# Altium schematic sheet semubot_lidar_driver.SchDoc
size A3; SheetNumber: 1; SheetTotal: 2
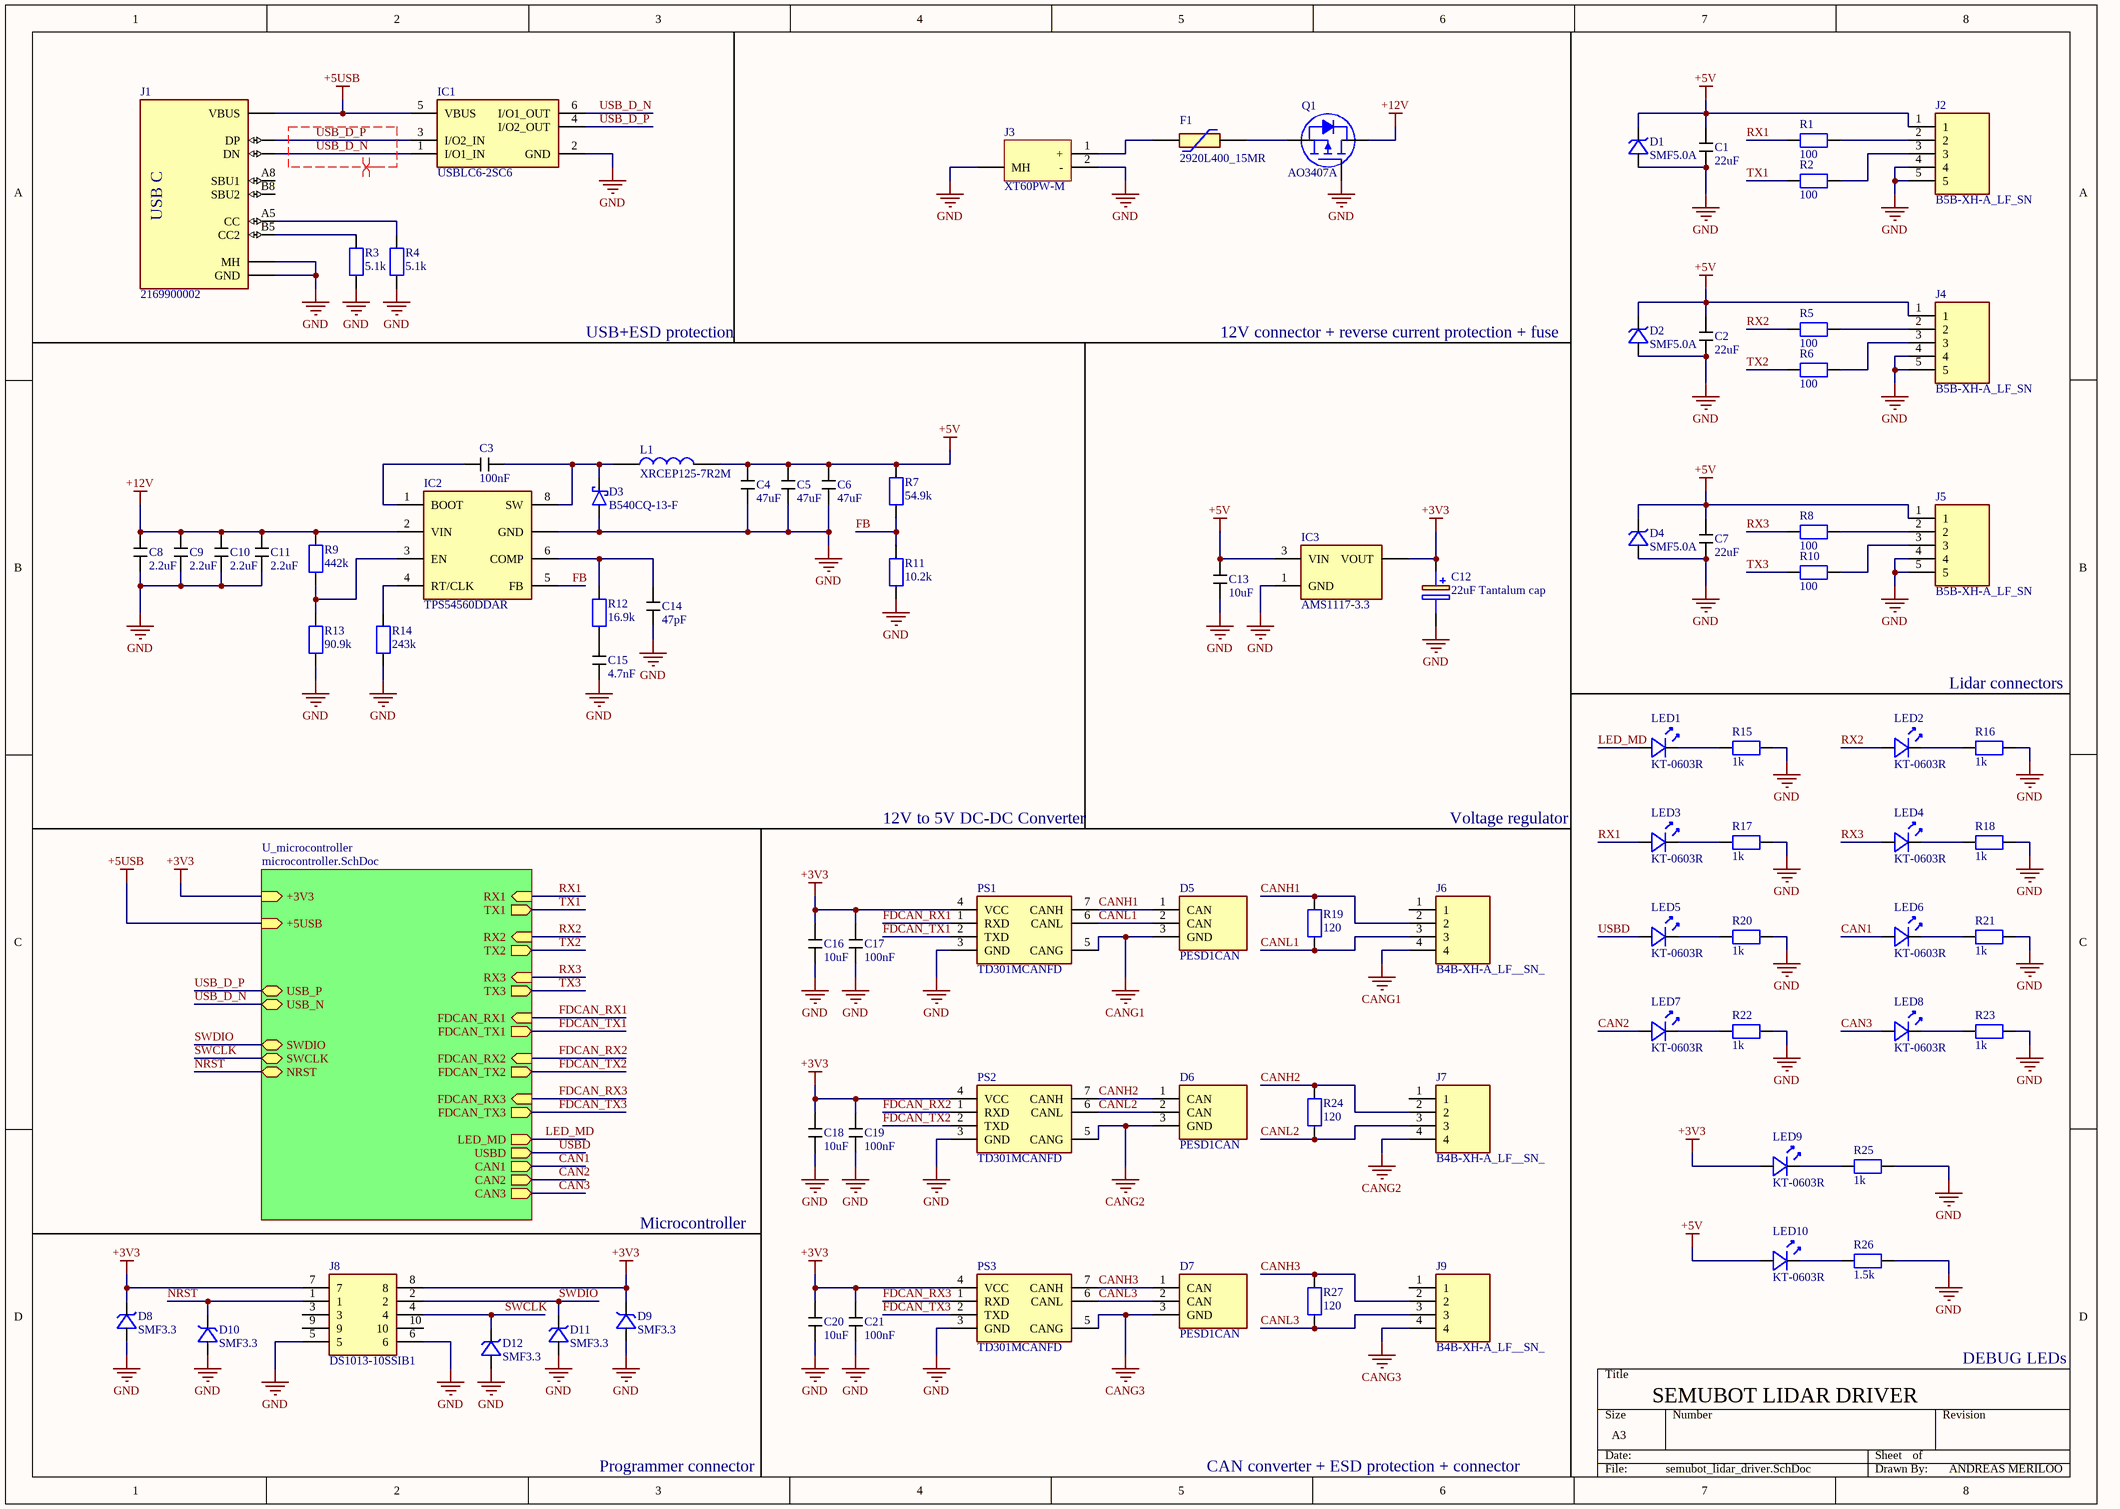
[diagram p0: semubot_lidar_driver.SchDoc]

## Parts
C1  22uF  [0805Capacitor]
C2  22uF  [0805Capacitor]
C3  100nF  [0603Capacitor]
C4  47uF  [1206CAPACITOR]
C5  47uF  [1206CAPACITOR]
C6  47uF  [1206CAPACITOR]
C7  22uF  [0805Capacitor]
C8  2.2uF  [1206CAPACITOR]
C9  2.2uF  [1206CAPACITOR]
C10  2.2uF  [1206CAPACITOR]
C11  2.2uF  [1206CAPACITOR]
C12  22uF Tantalum cap  [CAPPM3216X180N]
C13  10uF  [1206CAPACITOR]
C14  47pF  [0603Capacitor]
C15  4.7nF  [0805Capacitor]
C16  10uF  [1206CAPACITOR]
C17  100nF  [0603Capacitor]
C18  10uF  [1206CAPACITOR]
C19  100nF  [0603Capacitor]
C20  10uF  [1206CAPACITOR]
C21  100nF  [0603Capacitor]
D1  SMF5.0A  [SMF5.0A]
D2  SMF5.0A  [SMF5.0A]
D3  B540CQ-13-F  [B540CQ-13-F]
D4  SMF5.0A  [SMF5.0A]
D5  PESD1CAN  [SOT95P230X110-3N]
D6  PESD1CAN  [SOT95P230X110-3N]
D7  PESD1CAN  [SOT95P230X110-3N]
D8  SMF3.3  [SMF3.3]
D9  SMF3.3  [SMF3.3]
D10  SMF3.3  [SMF3.3]
D11  SMF3.3  [SMF3.3]
D12  SMF3.3  [SMF3.3]
F1  2920L400_15MR  [2920L07560MR]
IC1  USBLC6-2SC6  [USBLC6-2SC6]
IC2  TPS54560DDAR  [TPS54560DDAR]
IC3  AMS1117-3.3  [AMS1117-3.3]
J1  2169900002  [2169900002]
J2  B5B-XH-A_LF_SN  [B5B-XH-A(LF)(SN)]
J3  XT60PW-M  [XT60PW-M]
J4  B5B-XH-A_LF_SN  [B5B-XH-A(LF)(SN)]
J5  B5B-XH-A_LF_SN  [B5B-XH-A(LF)(SN)]
J6  B4B-XH-A_LF__SN_  [B4BXHALFSN]
J7  B4B-XH-A_LF__SN_  [B4BXHALFSN]
J8  DS1013-10SSIB1  [DS101310SSIB1]
J9  B4B-XH-A_LF__SN_  [B4BXHALFSN]
L1  XRCEP125-7R2M  [XRCEP125-7R2M]
LED1  KT-0603R  [LEDC1608X70N]
LED2  KT-0603R  [LEDC1608X70N]
LED3  KT-0603R  [LEDC1608X70N]
LED4  KT-0603R  [LEDC1608X70N]
LED5  KT-0603R  [LEDC1608X70N]
LED6  KT-0603R  [LEDC1608X70N]
LED7  KT-0603R  [LEDC1608X70N]
LED8  KT-0603R  [LEDC1608X70N]
LED9  KT-0603R  [LEDC1608X70N]
LED10  KT-0603R  [LEDC1608X70N]
PS1  TD301MCANFD  [TD301MCANFD]
PS2  TD301MCANFD  [TD301MCANFD]
PS3  TD301MCANFD  [TD301MCANFD]
Q1  AO3407A  [SOT95P280X125-3N]
R1  100  [0603Resistor]
R2  100  [0603Resistor]
R3  5.1k  [0603Resistor]
R4  5.1k  [0603Resistor]
R5  100  [0603Resistor]
R6  100  [0603Resistor]
R7  54.9k  [0603Resistor]
R8  100  [0603Resistor]
R9  442k  [0603Resistor]
R10  100  [0603Resistor]
R11  10.2k  [0603Resistor]
R12  16.9k  [0603Resistor]
R13  90.9k  [0603Resistor]
R14  243k  [0603Resistor]
R15  1k  [0603Resistor]
R16  1k  [0603Resistor]
R17  1k  [0603Resistor]
R18  1k  [0603Resistor]
R19  120  [0603Resistor]
R20  1k  [0603Resistor]
R21  1k  [0603Resistor]
R22  1k  [0603Resistor]
R23  1k  [0603Resistor]
R24  120  [0603Resistor]
R25  1k  [0603Resistor]
R26  1.5k  [0603Resistor]
R27  120  [0603Resistor]

## Sub-sheets
U_microcontroller = microcontroller.SchDoc: +3V3 (in), CAN3 (out), CAN2 (out), CAN1 (out), USBD (out), LED_MD (out), FDCAN_TX3 (out), FDCAN_RX3 (in), FDCAN_TX2 (out), FDCAN_RX2 (in), FDCAN_TX1 (out), FDCAN_RX1 (in), TX3 (out), RX3 (in), TX2 (out), RX2 (in), TX1 (out), RX1 (in), +5USB (in), SWDIO (bidir), SWCLK (bidir), NRST (bidir), USB_N (bidir), USB_P (bidir)

## Nets
+3V3: C12.1(+) C16.2 C17.2 C18.2 C19.2 C20.2 C21.2 D8.2 D9.2 IC3.4(VOUT) J8.7 J8.8 LED9.1 PS1.4(VCC) PS2.4(VCC) PS3.4(VCC) ; sheet U_microcontroller/+3V3
+5USB: IC1.5(VBUS) J1.A4(VBUS) ; sheet U_microcontroller/+5USB
+5V: C1.2 C2.2 C4.2 C5.2 C6.2 C7.2 C13.2 D1.2 D2.2 D4.2 IC3.3(VIN) J2.1 J4.1 J5.1 L1.2 LED10.1 R7.2
+12V: C8.2 C9.2 C10.2 C11.2 IC2.2(VIN) Q1.2 R9.2
CANG1: D5.3(GND) J6.4 PS1.5(CANG)
CANG2: D6.3(GND) J7.4 PS2.5(CANG)
CANG3: D7.3(GND) J9.4 PS3.5(CANG)
GND: C1.1 C2.1 C4.1 C5.1 C6.1 C7.1 C8.1 C9.1 C10.1 C11.1 C12.2(-) C13.1 C14.1 C15.1 C16.1 C17.1 C18.1 C19.1 C20.1 C21.1 D1.1 D2.1 D3.2(A) D4.1 D8.1 D9.1 D10.1 D11.1 D12.1 IC1.2(GND) IC2.7(GND) IC3.1(GND) J1.A1(GND) J1.MH1(MH) J2.4 J2.5 J3.2(-) J3.3(MH) J4.4 J4.5 J5.4 J5.5 J8.5 J8.6 PS1.3(GND) PS2.3(GND) PS3.3(GND) Q1.1 R3.1 R4.1 R11.1 R13.1 R14.1 R15.2 R16.2 R17.2 R18.2 R20.2 R21.2 R22.2 R23.2 R25.2 R26.2
CAN1: LED6.1 ; sheet U_microcontroller/CAN1
CAN2: LED7.1 ; sheet U_microcontroller/CAN2
CAN3: LED8.1 ; sheet U_microcontroller/CAN3
CANH1: D5.1(CAN) J6.2 PS1.7(CANH) R19.2
CANH2: D6.1(CAN) J7.2 PS2.7(CANH) R24.2
CANH3: D7.1(CAN) J9.2 PS3.7(CANH) R27.2
CANL1: D5.2(CAN) J6.3 PS1.6(CANL) R19.1
CANL2: D6.2(CAN) J7.3 PS2.6(CANL) R24.1
CANL3: D7.2(CAN) J9.3 PS3.6(CANL) R27.1
FB: IC2.5(FB) R7.1 R11.2
FDCAN_RX1: PS1.1(RXD) ; sheet U_microcontroller/FDCAN_RX1
FDCAN_RX2: PS2.1(RXD) ; sheet U_microcontroller/FDCAN_RX2
FDCAN_RX3: PS3.1(RXD) ; sheet U_microcontroller/FDCAN_RX3
FDCAN_TX1: PS1.2(TXD) ; sheet U_microcontroller/FDCAN_TX1
FDCAN_TX2: PS2.2(TXD) ; sheet U_microcontroller/FDCAN_TX2
FDCAN_TX3: PS3.2(TXD) ; sheet U_microcontroller/FDCAN_TX3
LED_MD: LED1.1 ; sheet U_microcontroller/LED_MD
NRST: D10.2 J8.1 ; sheet U_microcontroller/NRST
RX1: LED3.1 R1.1 ; sheet U_microcontroller/RX1
RX2: LED2.1 R5.1 ; sheet U_microcontroller/RX2
RX3: LED4.1 R8.1 ; sheet U_microcontroller/RX3
SWCLK: D12.2 J8.4 ; sheet U_microcontroller/SWCLK
SWDIO: D11.2 J8.2 ; sheet U_microcontroller/SWDIO
TX1: R2.1 ; sheet U_microcontroller/TX1
TX2: R6.1 ; sheet U_microcontroller/TX2
TX3: R10.1 ; sheet U_microcontroller/TX3
USB_D_N: IC1.1(I/O1_IN) IC1.6(I/O1_OUT) J1.A7(DN) ; sheet U_microcontroller/USB_N
USB_D_P: IC1.3(I/O2_IN) IC1.4(I/O2_OUT) J1.A6(DP) ; sheet U_microcontroller/USB_P
USBD: LED5.1 ; sheet U_microcontroller/USBD
NetC3_1: C3.1 D3.1(K) IC2.8(SW) L1.1
NetC3_2: C3.2 IC2.1(BOOT)
NetC14_2: C14.2 IC2.6(COMP) R12.2
NetC15_2: C15.2 R12.1
NetF1_1: F1.1 J3.1(+)
NetF1_2: F1.2 Q1.3
NetIC2_3: IC2.3(EN) R9.1 R13.2
NetIC2_4: IC2.4(RT/CLK) R14.2
NetJ1_A5: J1.A5(CC) R4.2
NetJ1_B5: J1.B5(CC2) R3.2
NetJ2_2: J2.2 R1.2
NetJ2_3: J2.3 R2.2
NetJ4_2: J4.2 R5.2
NetJ4_3: J4.3 R6.2
NetJ5_2: J5.2 R8.2
NetJ5_3: J5.3 R10.2
NetLED1_2: LED1.2 R15.1
NetLED2_2: LED2.2 R16.1
NetLED3_2: LED3.2 R17.1
NetLED4_2: LED4.2 R18.1
NetLED5_2: LED5.2 R20.1
NetLED6_2: LED6.2 R21.1
NetLED7_2: LED7.2 R22.1
NetLED8_2: LED8.2 R23.1
NetLED9_2: LED9.2 R25.1
NetLED10_2: LED10.2 R26.1

Not connected (* = marked no-connect by the designer): J1 A8(SBU1) B8(SBU2); J6 1; J7 1; J8 3 9 10; J9 1

## Layout directives
differential pair; differential pair class DIFF_90: USB_D_N, USB_D_P

## Notes on the sheet
- USB C
- USB+ESD protection
- (near D2) 12V connector + reverse current protection + fuse
- Lidar connectors
- 12V to 5V DC-DC Converter
- Voltage regulator
- Microcontroller
- DEBUG LEDs
- SEMUBOT LIDAR DRIVER
- Programmer connector
- CAN converter + ESD protection + connector
- ANDREAS MERILOO

## Library data of the parts
C1-C11 C13-C21 = Capacitor
  C1 C2 C7: Capacitance: 22uF
  C3 C17 C19 C21: Capacitance: 100nF
  C4-C6: Capacitance: 47uF
  C8-C11: Capacitance: 2.2uF
  C13 C16 C18 C20: Capacitance: 10uF
  C14: Capacitance: 47pF
  C15: Capacitance: 4.7nF
C12 = CA45-A010K226T: Capacitor Polarised C122643 CA45-A010K226T; Manufacturer_Name: Hunan Xiangyee in S&T; Datasheet Link: https://datasheet.lcsc.com/szlcsc/1811261831_Hunan-Xiangyee-in-S-T-CA45-A010K226T_C122643.pdf; Height: 1.8mm; Manufacturer_Part_Number: CA45-A010K226T
D1 D2 D4 = SMF5.0A: TVS diode; Supplier 1: Mouser; Supplier Part Number 1: SMF5.0A; ComponentLink1Description: Datasheet; ComponentLink1URL: https://www.littelfuse.com/assetdocs/tvs-diodes-smf-datasheet?assetguid=7EB8A5B6-BDD0-4561-8F19-0C3CC6F9B2AF
D3 = B540CQ-13-F: Schottky Diode; Manufacturer_Name: Diodes Incorporated; Datasheet Link: https://www.diodes.com/assets/Datasheets/ds13012.pdf; Height: 2.5mm; Manufacturer_Part_Number: B540CQ-13-F; Mouser Part Number: 621-B540CQ-13-F; Mouser Price/Stock: https://www.mouser.co.uk/ProductDetail/Diodes-Incorporated/B540CQ-13-F?qs=BvpHGKeVh3rbtYAYW%2FUwCw%3D%3D; Arrow Part Number: B540CQ-13-F; Arrow Price/Stock: https://www.arrow.com/en/products/b540cq-13-f/diodes-incorporated?utm_currency=USD&region=europe
D5-D7 = PESD1CAN: TVS Diode (Bi-directional); Manufacturer_Name: NXP; Datasheet Link: https://datasheet.preprod.pas.partquest.com/images/VipMasterIC/IC/PHGL/PHGLS15341/PHGLS15341-1.pdf?hkey=61A2E4C270F0397D049F8F05BD4F1054; Height: 1.1mm; Manufacturer_Part_Number: PESD1CAN; Mouser Part Number: N/A; Mouser Price/Stock: https://www.mouser.co.uk/ProductDetail/NXP-Semiconductors/PESD1CAN?qs=55YtniHzbhBnD7lYYuVpRQ%3D%3D
D8-D12 = SMF3.3: TVS DIODE 3V3; ComponentLink1Description: Datasheet; ComponentLink1URL: https://www.littelfuse.com/assetdocs/tvs-diodes-smf3-3-datasheet?assetguid=2E80CD26-B0C3-442F-9D77-27A283CCFF4F
F1 = 2920L400_15MR: Resettable Fuse; Manufacturer_Name: LITTELFUSE; Manufacturer_Part_Number: 2920L400/15MR; Datasheet Link: http://m.littelfuse.com/~/media/electronics/datasheets/resettable_ptcs/littelfuse_ptc_2920l_datasheet.pdf.pdf; Height: 1.8mm; Mouser Part Number: 576-2920L400/15MR; Mouser Price/Stock: https://www.mouser.co.uk/ProductDetail/Littelfuse/2920L400-15MR?qs=%2FPOkb%252BiDxRVcBFTgv8H%2FIw%3D%3D; Arrow Part Number: 2920L400/15MR; Arrow Price/Stock: https://www.arrow.com/en/products/2920l40015mr/littelfuse?utm_currency=USD&region=nac
IC1 = USBLC6-2SC6: Integrated Circuit; Manufacturer_Name: STMicroelectronics; Datasheet Link: https://www.st.com/resource/en/datasheet/usblc6-2.pdf; Height: 1.45mm; Manufacturer_Part_Number: USBLC6-2SC6; Mouser Part Number: 511-USBLC6-2SC6; Mouser Price/Stock: https://www.mouser.co.uk/ProductDetail/STMicroelectronics/USBLC6-2SC6?qs=po45yt2pPpu%2FhNIlwQdTlg%3D%3D; Arrow Part Number: USBLC6-2SC6; Arrow Price/Stock: https://www.arrow.com/en/products/usblc6-2sc6/stmicroelectronics.html?utm_currency=USD&region=nac
IC2 = TPS54560DDAR: Integrated Circuit; pin to pad: 7>7+9; Manufacturer_Name: Texas Instruments; Datasheet Link: http://www.ti.com/lit/ds/symlink/tps54560.pdf; Height: 1.7mm; Manufacturer_Part_Number: TPS54560DDAR; Mouser Part Number: 595-TPS54560DDAR; Mouser Price/Stock: https://www.mouser.co.uk/ProductDetail/Texas-Instruments/TPS54560DDAR?qs=%2FA2SZCkL4Tlm1gC5t8ZNIg%3D%3D; Arrow Part Number: TPS54560DDAR; Arrow Price/Stock: https://www.arrow.com/en/products/tps54560ddar/texas-instruments?region=nac
IC3 = AMS1117-3.3: Integrated Circuit; Manufacturer_Name: Advanced Monolithic Systems; Manufacturer_Part_Number: AMS1117-1.5; Datasheet Link: http://www.advanced-monolithic.com/pdf/ds1117.pdf; Height: 1.8mm
J1 = 2169900002: Connector; pin to pad: A1>A1+A12 A4>A4+A9 A6>A6+B6 A7>A7+B7 MH1>MH1+MH2+MH3+MH4; Manufacturer_Name: Molex; Datasheet Link: https://www.molex.com/en-us/products/part-detail-pdf/2169900002?display=pdf; Height: 3.36mm; Manufacturer_Part_Number: 2169900002; Arrow Part Number: 2169900002; Arrow Price/Stock: https://www.arrow.com/en/products/2169900002/molex.html?utm_currency=USD&region=nac
J2 J4 J5 = B5B-XH-A_LF_SN: Connector; Manufacturer_Name: JST (JAPAN SOLDERLESS TERMINALS); Datasheet Link: http://www.jst-mfg.com/product/pdf/eng/eXH.pdf; Height: 7mm; Manufacturer_Part_Number: B5B-XH-A(LF)(SN); Mouser Part Number: N/A; Mouser Price/Stock: https://www.mouser.co.uk/ProductDetail/JST-Commercial/B5B-XH-ALFSN?qs=IKkN%2F947nfBtEhlRye3uAw%3D%3D; Arrow Part Number: B5B-XH-A(LF)(SN); Arrow Price/Stock: https://www.arrow.com/en/products/b5b-xh-a-lf-sn/jst-manufacturing.html?utm_currency=USD&region=europe
J3 = XT60PW-M: Connector: DC supply; socket; male; power supply; XT60; 30A; 500V; pin to pad: 3>MH1+MH2; ComponentLink1Description: Datasheet; ComponentLink1URL: https://www.tme.eu/Document/b13629717d44ae038681dba08d18c0b6/XT60PW-M.pdf
J6 J7 J9 = B4B-XH-A_LF__SN_: Connector; Manufacturer_Name: JST (JAPAN SOLDERLESS TERMINALS); Manufacturer_Part_Number: B4B-XH-A(LF)(SN); Datasheet Link: https://datasheet.lcsc.com/szlcsc/JST-Sales-America-B4B-XH-A-LF-SN_C144395.pdf; Height: 7mm; Mouser Part Number: 306-B4BXHALFSN; Mouser Price/Stock: https://www.mouser.co.uk/ProductDetail/JST-Commercial/B4B-XH-ALFSN?qs=cdbOS8ANM9CfC08d%252BywhFw%3D%3D; Arrow Part Number: B4B-XH-A(LF)(SN); Arrow Price/Stock: https://www.arrow.com/en/products/b4b-xh-a-lf-sn/jst-manufacturing.html?utm_currency=USD&region=europe
J8 = DS1013-10SSIB1: Connector; Manufacturer_Name: Connfly; Datasheet Link: https://www.tme.com/Document/27ec11f62a6bc702dcb7110a541f177d/DS1013.pdf; Height: 9.55mm; Manufacturer_Part_Number: DS1013-10SSIB1
LED1-LED10 = KT-0603R: LED; Manufacturer_Name: Hubei KENTO Elec; Datasheet Link: https://datasheet.lcsc.com/szlcsc/Hubei-KENTO-Elec-KT-0603R_C2286.pdf; Height: 0.7mm; Manufacturer_Part_Number: KT-0603R
PS1-PS3 = TD301MCANFD: Power Supply; Manufacturer_Name: Mornsun Power; Datasheet Link: https://www.mornsun-power.com/public/uploads/pdf/TD5(3)01MCANFD.pdf; Height: 8.45mm; Manufacturer_Part_Number: TD301MCANFD
Q1 = AO3407A: MOSFET (P-Channel); Manufacturer_Name: Alpha & Omega Semiconductors; Height: 1.25mm; Manufacturer_Part_Number: AO3407A; Arrow Part Number: AO3401A; Arrow Price/Stock: https://www.arrow.com/en/products/ao3401a/alpha-and-omega-semiconductor.html?utm_currency=USD&region=nac
R1-R27 = Resistor: SMD Resistor
  R1 R2 R5 R6 R8 R10: Resistance: 100
  R3 R4: Resistance: 5.1k
  R7: Resistance: 54.9k
  R9: Resistance: 442k
  R11: Resistance: 10.2k
  R12: Resistance: 16.9k
  R13: Resistance: 90.9k
  R14: Resistance: 243k
  R15-R18 R20-R23 R25: Resistance: 1k
  R19 R24 R27: Resistance: 120
  R26: Resistance: 1.5k